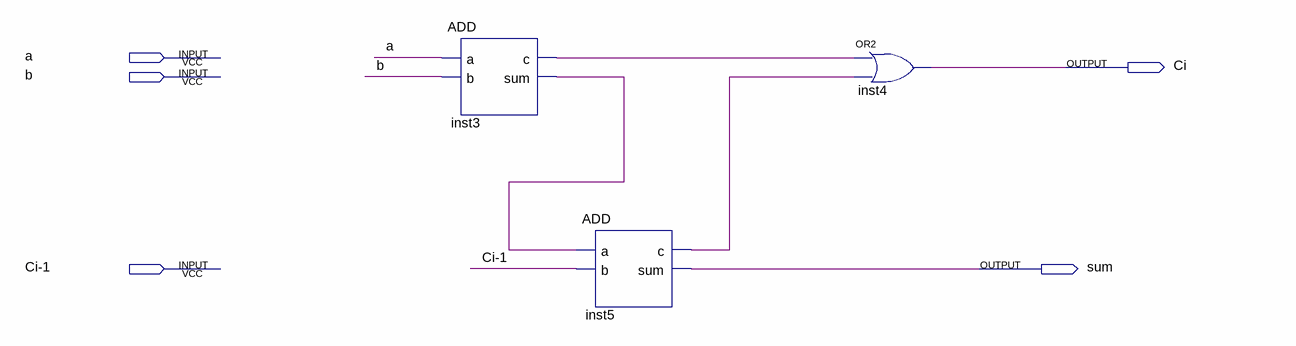
[diagram p0: schematic sheet]
// Quartus schematic full_ADD.bdf as structural Verilog: 3 symbols, 5 pins
module full_ADD (
  input  a,
  input  b,
  input  \Ci-1 ,
  output Ci,
  output sum
);

  wire inst3_c, inst3_sum, inst5_c;

  ADD inst3 (.a(a), .b(b), .c(inst3_c), .sum(inst3_sum));
  ADD inst5 (.a(inst3_sum), .b(\Ci-1 ), .c(inst5_c), .sum(sum));
  or inst4 (Ci, inst3_c, inst5_c);
endmodule
